# Altium project Orion-Bridge-R4.PrjPcb
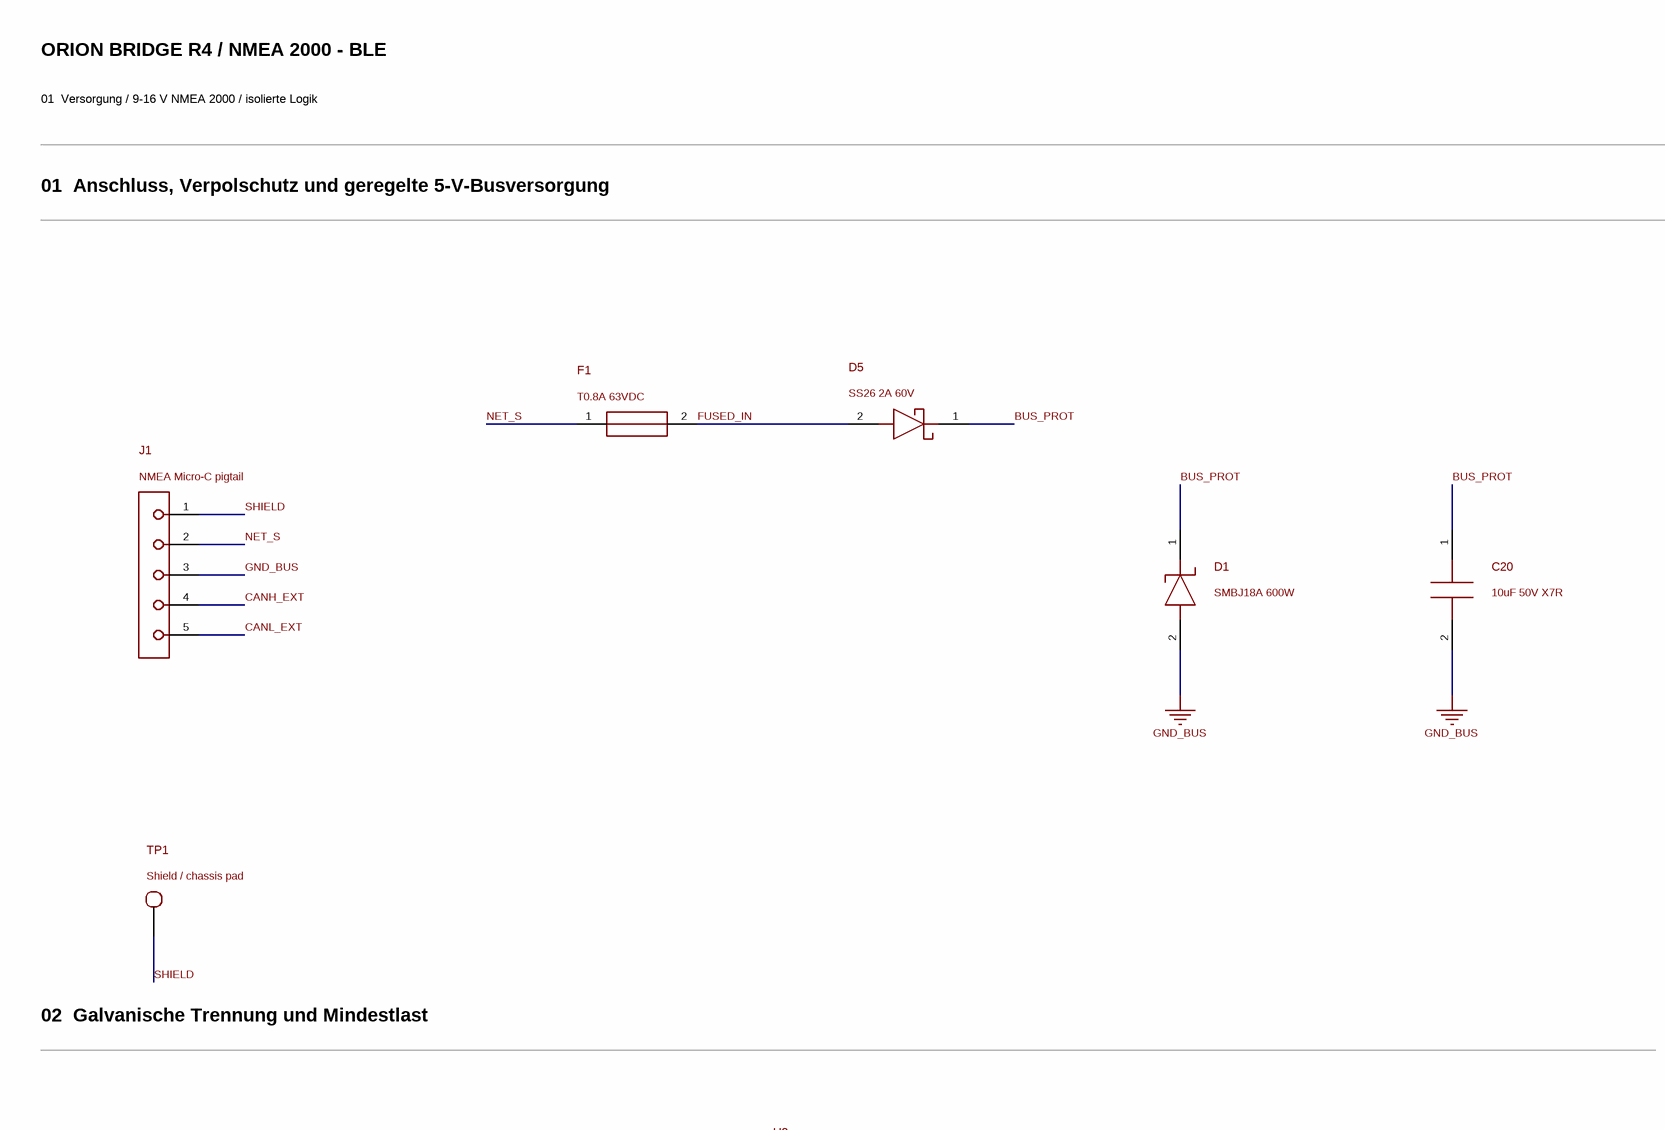
[diagram p0: Orion-Bridge-R4-Power.SchDoc, top left]
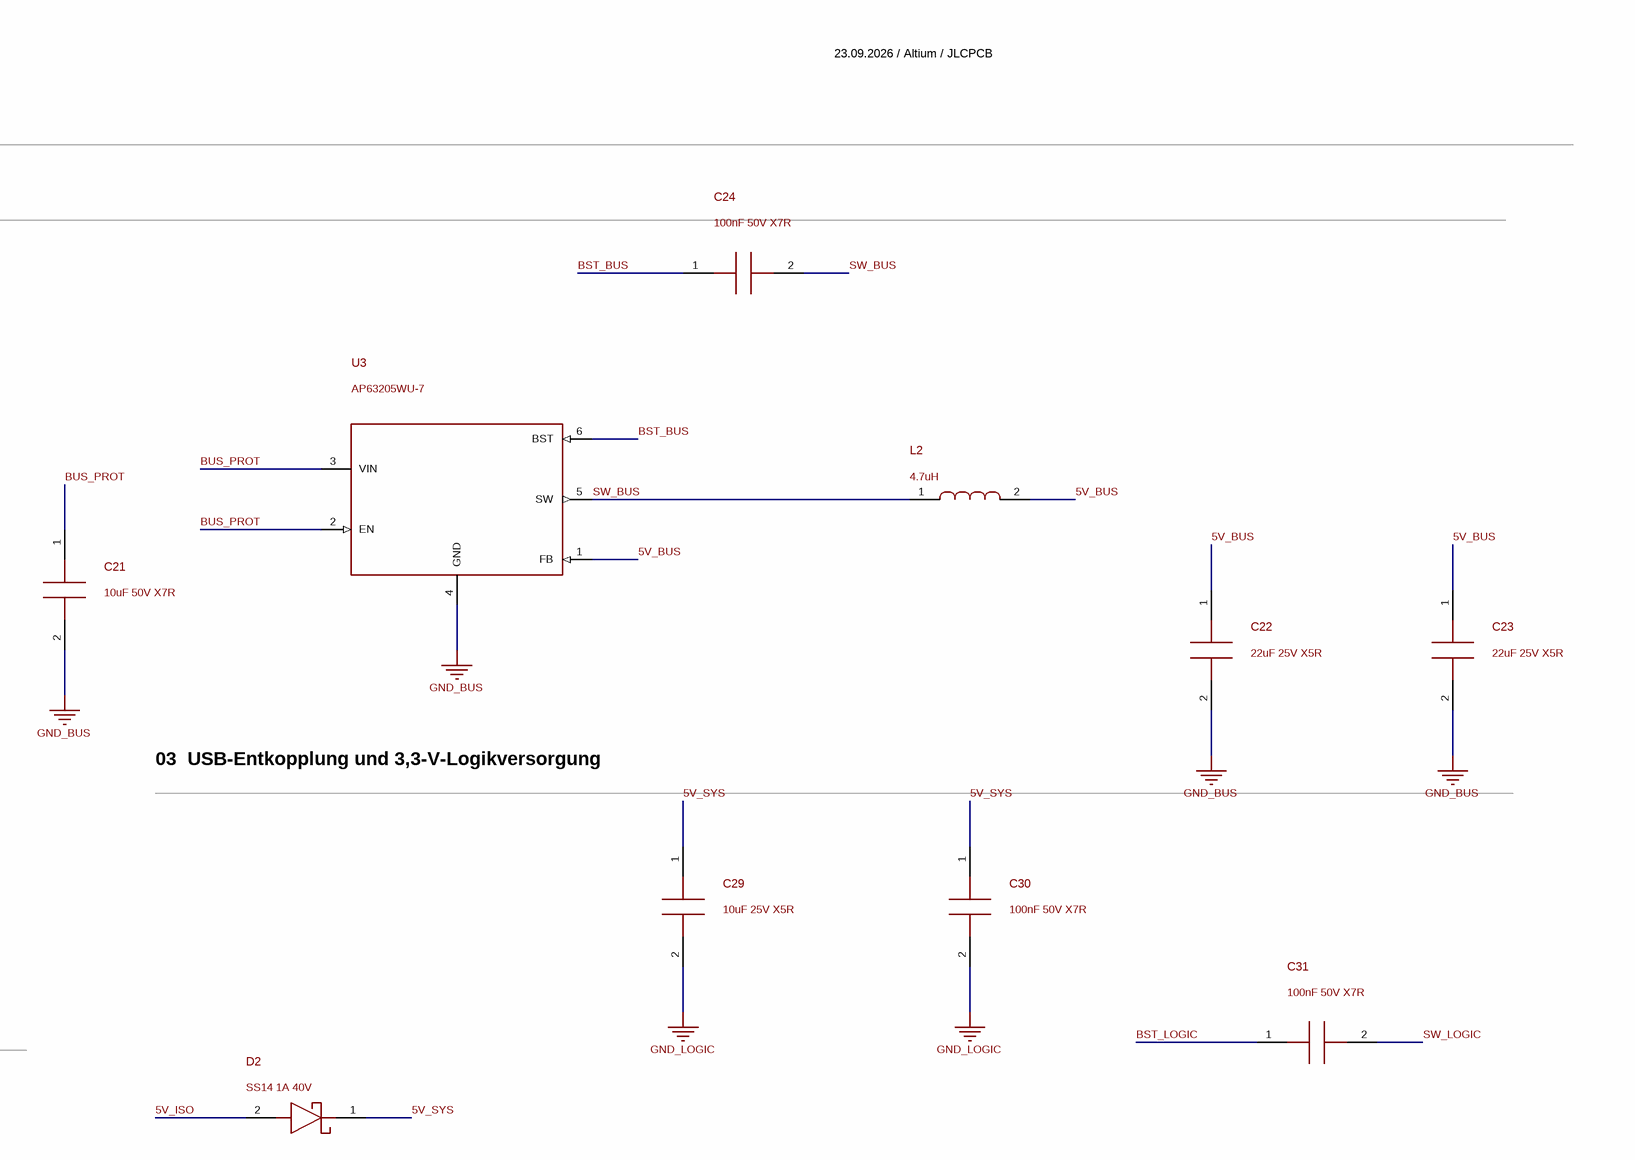
[diagram p1: Orion-Bridge-R4-Power.SchDoc, top right]
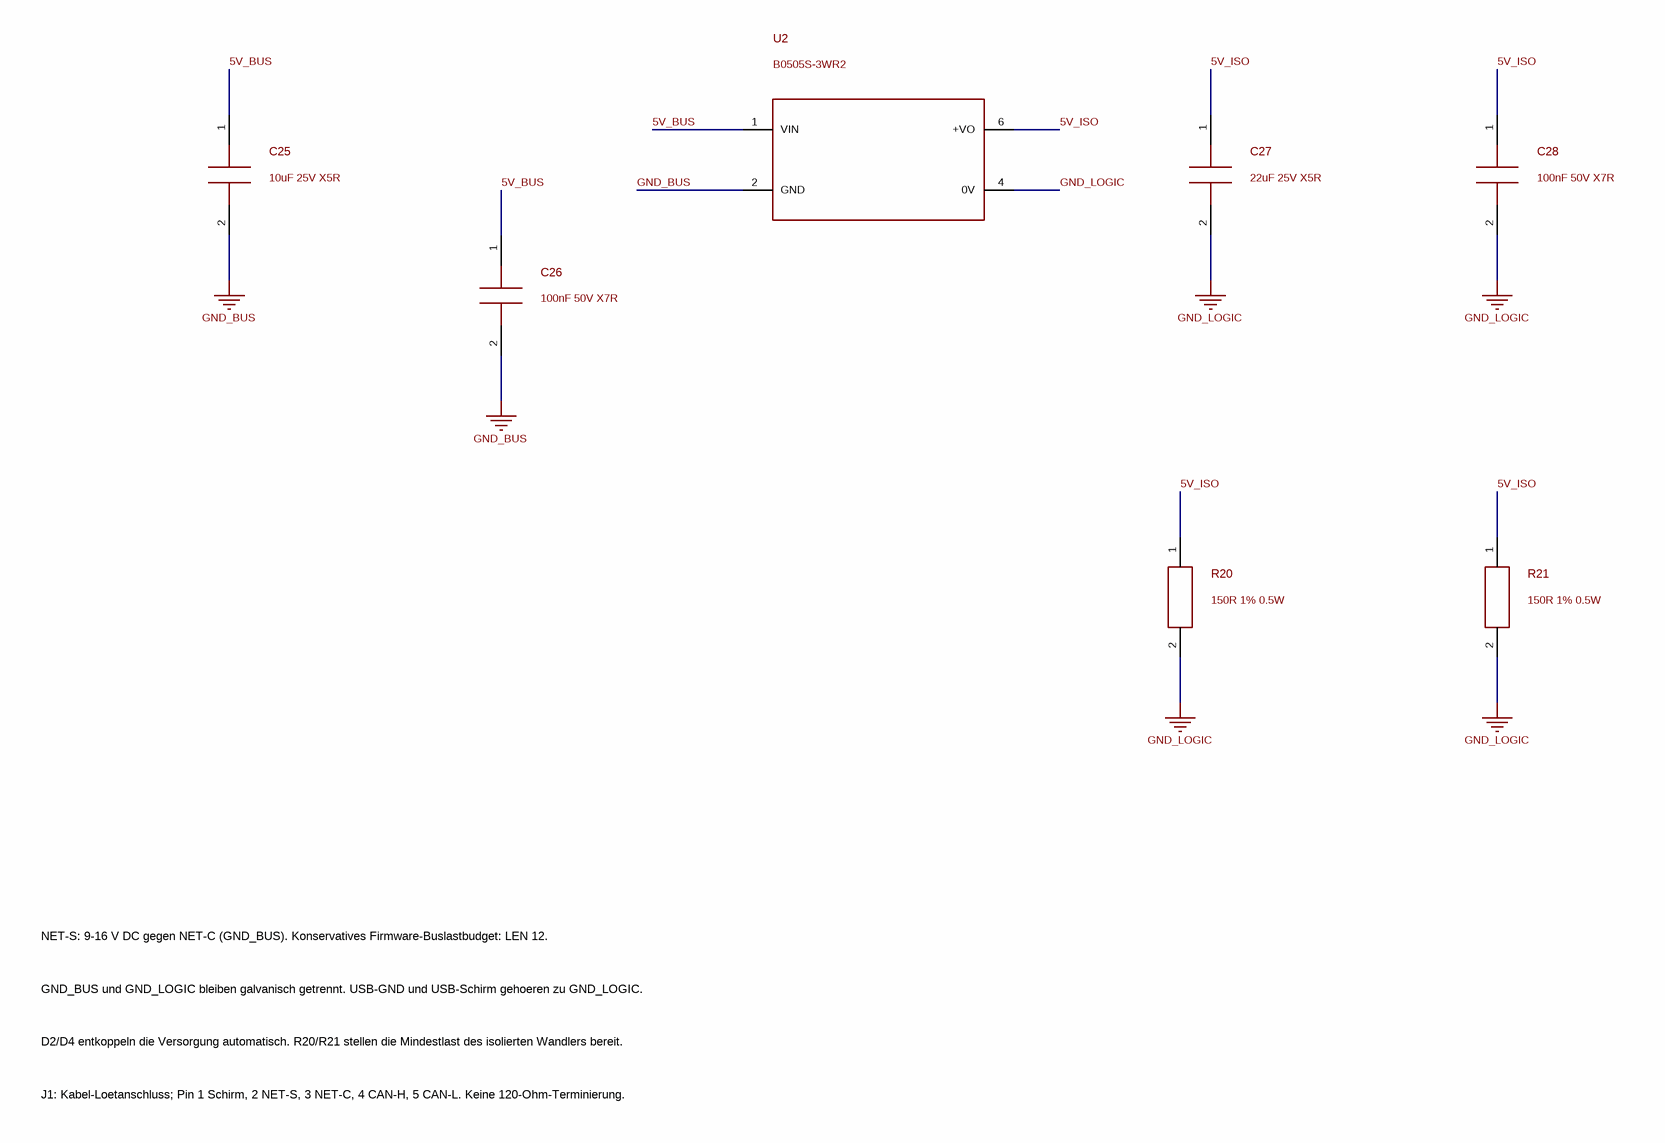
[diagram p2: Orion-Bridge-R4-Power.SchDoc, bottom left]
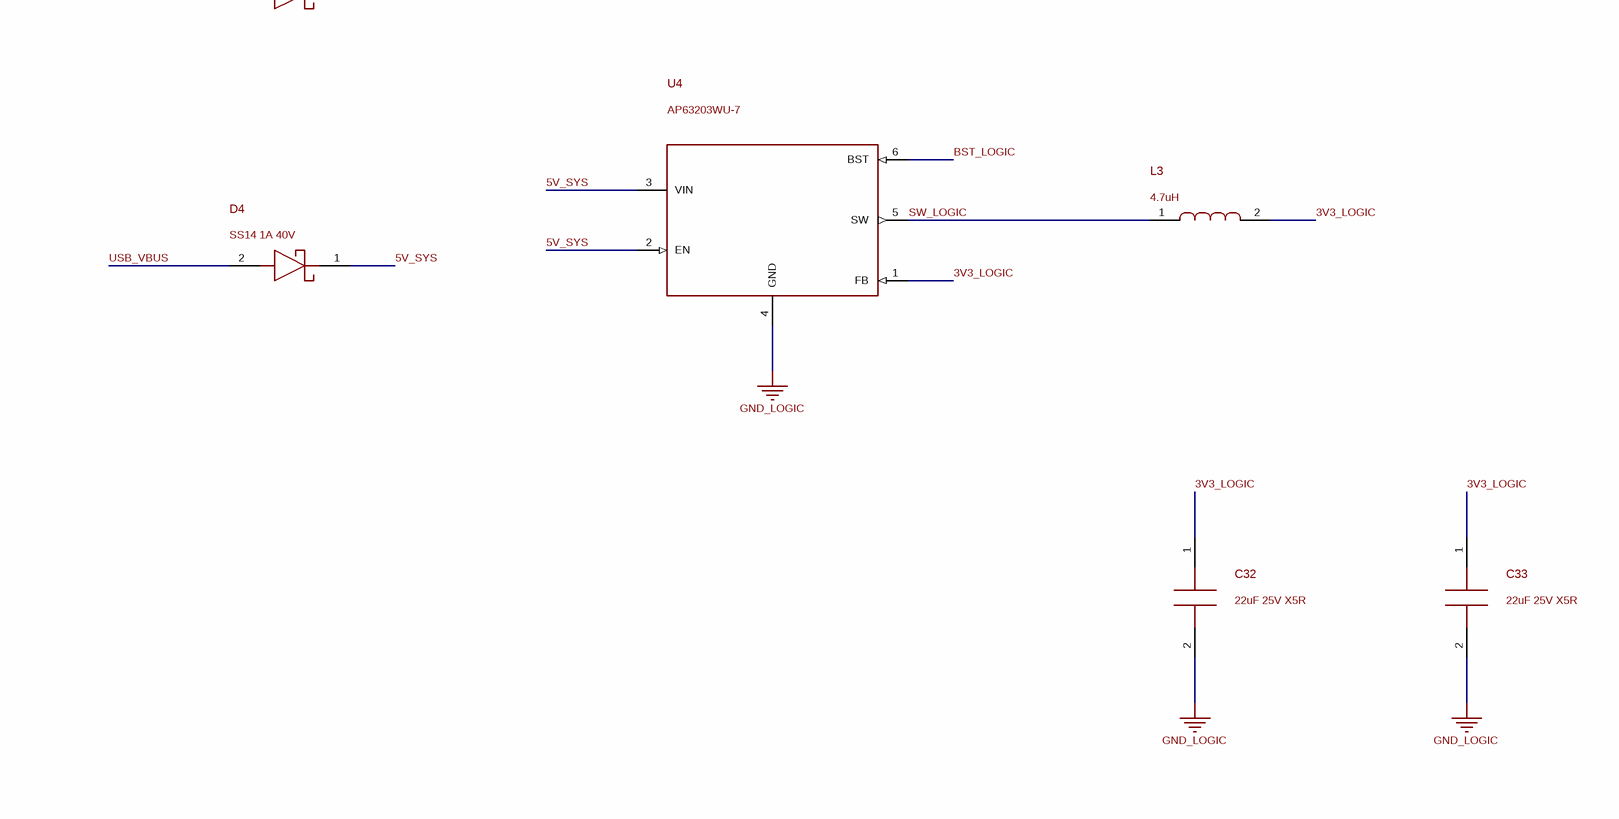
[diagram p3: Orion-Bridge-R4-Power.SchDoc, bottom right]
2 sheets, 52 parts. Net scope: global (net labels, ports and power ports of the same name join across sheets).
Board file: Orion-Bridge-R4.PcbDoc
Sheets:
  Orion-Bridge-R4-Power.SchDoc
  Orion-Bridge-R4-Logic.SchDoc

## Sheet Orion-Bridge-R4-Power.SchDoc
size A2

### Parts
C20  10uF 50V X7R  [C1210]
C21  10uF 50V X7R  [C1210]
C22  22uF 25V X5R  [C1206]
C23  22uF 25V X5R  [C1206]
C24  100nF 50V X7R  [C0603]
C25  10uF 25V X5R  [C0805]
C26  100nF 50V X7R  [C0603]
C27  22uF 25V X5R  [C1206]
C28  100nF 50V X7R  [C0603]
C29  10uF 25V X5R  [C0805]
C30  100nF 50V X7R  [C0603]
C31  100nF 50V X7R  [C0603]
C32  22uF 25V X5R  [C1206]
C33  22uF 25V X5R  [C1206]
D1  SMBJ18A 600W  [SMB]
D2  SS14 1A 40V  [SMA]
D4  SS14 1A 40V  [SMA]
D5  SS26 2A 60V  [SMA]
F1  T0.8A 63VDC  [BOURNS_SF1206S]
J1  NMEA Micro-C pigtail  [PIGTAIL_5_P3_D1P3]
L2  4.7uH  [SUNLORD_SWPA4030]
L3  4.7uH  [SUNLORD_SWPA4030]
R20  150R 1% 0.5W  [R1206]
R21  150R 1% 0.5W  [R1206]
TP1  Shield / chassis pad  [TESTPOINT_2MM]
U2  B0505S-3WR2  [EVISUN_B0505S_3WR2]
U3  AP63205WU-7  [TSOT26_DIODES]
U4  AP63203WU-7  [TSOT26_DIODES]

### Nets
GND_BUS: C20.2 C21.2 C22.2 C23.2 C25.2 C26.2 D1.2(A) J1.3(NET-C) U2.2(GND) U3.4(GND)
GND_LOGIC: C27.2 C28.2 C29.2 C30.2 C32.2 C33.2 R20.2 R21.2 U2.4(0V) U4.4(GND)
3V3_LOGIC: C32.1 C33.1 L3.2 U4.1(FB)
5V_BUS: C22.1 C23.1 C25.1 C26.1 L2.2 U2.1(VIN) U3.1(FB)
5V_ISO: C27.1 C28.1 D2.2(A) R20.1 R21.1 U2.6(+VO)
5V_SYS: C29.1 C30.1 D2.1(K) D4.1(K) U4.2(EN) U4.3(VIN)
BST_BUS: C24.1 U3.6(BST)
BST_LOGIC: C31.1 U4.6(BST)
BUS_PROT: C20.1 C21.1 D1.1(K) D5.1(K) U3.2(EN) U3.3(VIN)
CANH_EXT: J1.4(CAN-H)
CANL_EXT: J1.5(CAN-L)
FUSED_IN: D5.2(A) F1.2
NET_S: F1.1 J1.2(NET-S)
SHIELD: J1.1(SHIELD) TP1.1(SHIELD)
SW_BUS: C24.2 L2.1 U3.5(SW)
SW_LOGIC: C31.2 L3.1 U4.5(SW)
USB_VBUS: D4.2(A)

### Notes on the sheet
- ORION BRIDGE R4 / NMEA 2000 - BLE
- 23.09.2026 / Altium / JLCPCB
- 01  Versorgung / 9-16 V NMEA 2000 / isolierte Logik
- 01  Anschluss, Verpolschutz und geregelte 5-V-Busversorgung
- 03  USB-Entkopplung und 3,3-V-Logikversorgung
- 02  Galvanische Trennung und Mindestlast
- NET-S: 9-16 V DC gegen NET-C (GND_BUS). Konservatives Firmware-Buslastbudget: LEN 12.
- GND_BUS und GND_LOGIC bleiben galvanisch getrennt. USB-GND und USB-Schirm gehoeren zu GND_LOGIC.
- D2/D4 entkoppeln die Versorgung automatisch. R20/R21 stellen die Mindestlast des isolierten Wandlers bereit.
- J1: Kabel-Loetanschluss; Pin 1 Schirm, 2 NET-S, 3 NET-C, 4 CAN-H, 5 CAN-L. Keine 120-Ohm-Terminierung.

### Library data of the parts
C20 = R4_C20_10uF: Manufacturer: Samsung Electro-Mechanics; MPN: CL32B106KBJNNNE; ReviewStatus: R4 reviewed package; see source and assembly audit; Manufacturer Part Number: CL32B106KBJNNNE; Description: 10uF 50V X7R; Datasheet: https://datasheet.lcsc.com/lcsc/1912112237_Samsung-Electro-Mechanics-CL32B106KBJNNNE_C138687.pdf; Supplier 1: LCSC; Supplier Part Number 1: C138687; Footprint Status: R4 reviewed package; see source and assembly audit
C21 = R4_C21_10uF: Manufacturer: Samsung Electro-Mechanics; MPN: CL32B106KBJNNNE; ReviewStatus: R4 reviewed package; see source and assembly audit; Manufacturer Part Number: CL32B106KBJNNNE; Description: 10uF 50V X7R; Datasheet: https://datasheet.lcsc.com/lcsc/1912112237_Samsung-Electro-Mechanics-CL32B106KBJNNNE_C138687.pdf; Supplier 1: LCSC; Supplier Part Number 1: C138687; Footprint Status: R4 reviewed package; see source and assembly audit
C22 = R4_C22_22uF: Manufacturer: Samsung Electro-Mechanics; MPN: CL31A226KAHNNNE; ReviewStatus: R4 reviewed package; see source and assembly audit; Manufacturer Part Number: CL31A226KAHNNNE; Description: 22uF 25V X5R; Datasheet: https://www.lcsc.com/datasheet/lcsc_datasheet_2304140030_Samsung-Electro-Mechanics-CL31A226KAHNNNE_C12891.pdf; Supplier 1: LCSC; Supplier Part Number 1: C12891; Footprint Status: R4 reviewed package; see source and assembly audit
C23 = R4_C23_22uF: Manufacturer: Samsung Electro-Mechanics; MPN: CL31A226KAHNNNE; ReviewStatus: R4 reviewed package; see source and assembly audit; Manufacturer Part Number: CL31A226KAHNNNE; Description: 22uF 25V X5R; Datasheet: https://www.lcsc.com/datasheet/lcsc_datasheet_2304140030_Samsung-Electro-Mechanics-CL31A226KAHNNNE_C12891.pdf; Supplier 1: LCSC; Supplier Part Number 1: C12891; Footprint Status: R4 reviewed package; see source and assembly audit
C24 = R4_C24_100nF: Manufacturer: YAGEO; MPN: CC0603KRX7R9BB104; ReviewStatus: R4 reviewed package; see source and assembly audit; Manufacturer Part Number: CC0603KRX7R9BB104; Description: 100nF 50V X7R; Datasheet: https://www.lcsc.com/datasheet/lcsc_datasheet_2211101700_YAGEO-CC0603KRX7R9BB104_C14663.pdf; Supplier 1: LCSC; Supplier Part Number 1: C14663; Footprint Status: R4 reviewed package; see source and assembly audit
C25 = R4_C25_10uF: Manufacturer: Samsung Electro-Mechanics; MPN: CL21A106KAYNNNE; ReviewStatus: R4 reviewed package; see source and assembly audit; Manufacturer Part Number: CL21A106KAYNNNE; Description: 10uF 25V X5R; Datasheet: https://www.lcsc.com/datasheet/lcsc_datasheet_2304140030_Samsung-Electro-Mechanics-CL21A106KAYNNNE_C15850.pdf; Supplier 1: LCSC; Supplier Part Number 1: C15850; Footprint Status: R4 reviewed package; see source and assembly audit
C26 = R4_C26_100nF: Manufacturer: YAGEO; MPN: CC0603KRX7R9BB104; ReviewStatus: R4 reviewed package; see source and assembly audit; Manufacturer Part Number: CC0603KRX7R9BB104; Description: 100nF 50V X7R; Datasheet: https://www.lcsc.com/datasheet/lcsc_datasheet_2211101700_YAGEO-CC0603KRX7R9BB104_C14663.pdf; Supplier 1: LCSC; Supplier Part Number 1: C14663; Footprint Status: R4 reviewed package; see source and assembly audit
C27 = R4_C27_22uF: Manufacturer: Samsung Electro-Mechanics; MPN: CL31A226KAHNNNE; ReviewStatus: R4 reviewed package; see source and assembly audit; Manufacturer Part Number: CL31A226KAHNNNE; Description: 22uF 25V X5R; Datasheet: https://www.lcsc.com/datasheet/lcsc_datasheet_2304140030_Samsung-Electro-Mechanics-CL31A226KAHNNNE_C12891.pdf; Supplier 1: LCSC; Supplier Part Number 1: C12891; Footprint Status: R4 reviewed package; see source and assembly audit
C28 = R4_C28_100nF: Manufacturer: YAGEO; MPN: CC0603KRX7R9BB104; ReviewStatus: R4 reviewed package; see source and assembly audit; Manufacturer Part Number: CC0603KRX7R9BB104; Description: 100nF 50V X7R; Datasheet: https://www.lcsc.com/datasheet/lcsc_datasheet_2211101700_YAGEO-CC0603KRX7R9BB104_C14663.pdf; Supplier 1: LCSC; Supplier Part Number 1: C14663; Footprint Status: R4 reviewed package; see source and assembly audit
C29 = R4_C29_10uF: Manufacturer: Samsung Electro-Mechanics; MPN: CL21A106KAYNNNE; ReviewStatus: R4 reviewed package; see source and assembly audit; Manufacturer Part Number: CL21A106KAYNNNE; Description: 10uF 25V X5R; Datasheet: https://www.lcsc.com/datasheet/lcsc_datasheet_2304140030_Samsung-Electro-Mechanics-CL21A106KAYNNNE_C15850.pdf; Supplier 1: LCSC; Supplier Part Number 1: C15850; Footprint Status: R4 reviewed package; see source and assembly audit
C30 = R4_C30_100nF: Manufacturer: YAGEO; MPN: CC0603KRX7R9BB104; ReviewStatus: R4 reviewed package; see source and assembly audit; Manufacturer Part Number: CC0603KRX7R9BB104; Description: 100nF 50V X7R; Datasheet: https://www.lcsc.com/datasheet/lcsc_datasheet_2211101700_YAGEO-CC0603KRX7R9BB104_C14663.pdf; Supplier 1: LCSC; Supplier Part Number 1: C14663; Footprint Status: R4 reviewed package; see source and assembly audit
C31 = R4_C31_100nF: Manufacturer: YAGEO; MPN: CC0603KRX7R9BB104; ReviewStatus: R4 reviewed package; see source and assembly audit; Manufacturer Part Number: CC0603KRX7R9BB104; Description: 100nF 50V X7R; Datasheet: https://www.lcsc.com/datasheet/lcsc_datasheet_2211101700_YAGEO-CC0603KRX7R9BB104_C14663.pdf; Supplier 1: LCSC; Supplier Part Number 1: C14663; Footprint Status: R4 reviewed package; see source and assembly audit
C32 = R4_C32_22uF: Manufacturer: Samsung Electro-Mechanics; MPN: CL31A226KAHNNNE; ReviewStatus: R4 reviewed package; see source and assembly audit; Manufacturer Part Number: CL31A226KAHNNNE; Description: 22uF 25V X5R; Datasheet: https://www.lcsc.com/datasheet/lcsc_datasheet_2304140030_Samsung-Electro-Mechanics-CL31A226KAHNNNE_C12891.pdf; Supplier 1: LCSC; Supplier Part Number 1: C12891; Footprint Status: R4 reviewed package; see source and assembly audit
C33 = R4_C33_22uF: Manufacturer: Samsung Electro-Mechanics; MPN: CL31A226KAHNNNE; ReviewStatus: R4 reviewed package; see source and assembly audit; Manufacturer Part Number: CL31A226KAHNNNE; Description: 22uF 25V X5R; Datasheet: https://www.lcsc.com/datasheet/lcsc_datasheet_2304140030_Samsung-Electro-Mechanics-CL31A226KAHNNNE_C12891.pdf; Supplier 1: LCSC; Supplier Part Number 1: C12891; Footprint Status: R4 reviewed package; see source and assembly audit
D1 = R4_D1_SMBJ18A: Manufacturer: BORN; ReviewStatus: R4 reviewed package; see source and assembly audit; MPN: SMBJ18A; Manufacturer Part Number: SMBJ18A; Description: SMBJ18A 600W; Datasheet: https://www.lcsc.com/datasheet/lcsc_datasheet_2304140030_BORN-SMBJ18A_C152104.pdf; Supplier 1: LCSC; Supplier Part Number 1: C152104; Footprint Status: R4 reviewed package; see source and assembly audit
D2 = R4_D2_SS14: Manufacturer: MDD(Microdiode Semiconductor); ReviewStatus: R4 reviewed package; see source and assembly audit; MPN: SS14; Manufacturer Part Number: SS14; Description: SS14 1A 40V; Datasheet: https://www.lcsc.com/datasheet/lcsc_datasheet_2407101109_MDD-Microdiode-Semiconductor-SS14_C2480.pdf; Supplier 1: LCSC; Supplier Part Number 1: C2480; Footprint Status: R4 reviewed package; see source and assembly audit
D4 = R4_D4_SS14: Manufacturer: MDD(Microdiode Semiconductor); ReviewStatus: R4 reviewed package; see source and assembly audit; MPN: SS14; Manufacturer Part Number: SS14; Description: SS14 1A 40V; Datasheet: https://www.lcsc.com/datasheet/lcsc_datasheet_2407101109_MDD-Microdiode-Semiconductor-SS14_C2480.pdf; Supplier 1: LCSC; Supplier Part Number 1: C2480; Footprint Status: R4 reviewed package; see source and assembly audit
D5 = R4_D5_SS26: Manufacturer: MDD(Microdiode Semiconductor); ReviewStatus: R4 reviewed package; see source and assembly audit; MPN: SS26; Manufacturer Part Number: SS26; Description: SS26 2A 60V; Datasheet: https://www.lcsc.com/datasheet/lcsc_datasheet_2407101107_MDD-Microdiode-Semiconductor-SS26_C14238.pdf; Supplier 1: LCSC; Supplier Part Number 1: C14238; Footprint Status: R4 reviewed package; see source and assembly audit
F1 = R4_F1_T0.8A: 0.8 A slow-blow SMD ceramic fuse, 63 VDC, 50 A interrupt rating; Manufacturer: BOURNS; MPN: SF-1206S080-2; ReviewStatus: R4 reviewed package; see source and assembly audit; Manufacturer Part Number: SF-1206S080-2; Datasheet: https://wmsc.lcsc.com/wmsc/upload/file/pdf/v2/lcsc/2304140030_BOURNS-SF-1206S080-2_C3032873.pdf; Supplier 1: LCSC; Supplier Part Number 1: C3032873; Footprint Status: R4 reviewed package; see source and assembly audit
J1 = R4_J1_NMEA: Five direct wire-solder pads for a separately selected Micro-C cable; this is a PCB interface, not an invented connector MPN or face view; ReviewStatus: R4 reviewed package; see source and assembly audit; Footprint Status: R4 reviewed package; see source and assembly audit
L2 = R4_L2_4.7uH: Manufacturer: Sunlord; MPN: SWPA4030S4R7MT; ReviewStatus: R4 reviewed package; see source and assembly audit; Manufacturer Part Number: SWPA4030S4R7MT; Description: 4.7uH; Datasheet: https://www.lcsc.com/datasheet/lcsc_datasheet_2310251551_Sunlord-SWPA4030S4R7MT_C57269.pdf; Supplier 1: LCSC; Supplier Part Number 1: C57269; Footprint Status: R4 reviewed package; see source and assembly audit
L3 = R4_L3_4.7uH: Manufacturer: Sunlord; MPN: SWPA4030S4R7MT; ReviewStatus: R4 reviewed package; see source and assembly audit; Manufacturer Part Number: SWPA4030S4R7MT; Description: 4.7uH; Datasheet: https://www.lcsc.com/datasheet/lcsc_datasheet_2310251551_Sunlord-SWPA4030S4R7MT_C57269.pdf; Supplier 1: LCSC; Supplier Part Number 1: C57269; Footprint Status: R4 reviewed package; see source and assembly audit
R20 = R4_R20_150R: Manufacturer: SEI(Stackpole Elec); MPN: RNCP1206FTD150R; ReviewStatus: R4 reviewed package; see source and assembly audit; Manufacturer Part Number: RNCP1206FTD150R; Description: 150R 1% 0.5W; Datasheet: https://wmsc.lcsc.com/wmsc/upload/file/pdf/v2/lcsc/2404111532_SEI-Stackpole-Elec-RNCP1206FTD150R_C4258541.pdf; Supplier 1: LCSC; Supplier Part Number 1: C4258541; Footprint Status: R4 reviewed package; see source and assembly audit
R21 = R4_R21_150R: Manufacturer: SEI(Stackpole Elec); MPN: RNCP1206FTD150R; ReviewStatus: R4 reviewed package; see source and assembly audit; Manufacturer Part Number: RNCP1206FTD150R; Description: 150R 1% 0.5W; Datasheet: https://wmsc.lcsc.com/wmsc/upload/file/pdf/v2/lcsc/2404111532_SEI-Stackpole-Elec-RNCP1206FTD150R_C4258541.pdf; Supplier 1: LCSC; Supplier Part Number 1: C4258541; Footprint Status: R4 reviewed package; see source and assembly audit
TP1 = R4_TP1_Shield: Shield / chassis pad - generic specification; manufacturer/MPN not selected; ReviewStatus: R4 reviewed package; see source and assembly audit; Footprint Status: R4 reviewed package; see source and assembly audit
U2 = R4_U2_B0505S_3WR2: Manufacturer: EVISUN; ReviewStatus: R4 reviewed package; see source and assembly audit; MPN: B0505S-3WR2; Manufacturer Part Number: B0505S-3WR2; Description: B0505S-3WR2; Datasheet: https://wmsc.lcsc.com/wmsc/upload/file/pdf/v2/lcsc/2308311627_EVISUN-B0505S-3WR2_C7500927.pdf; Supplier 1: LCSC; Supplier Part Number 1: C7500927; Footprint Status: R4 reviewed package; see source and assembly audit
U3 = R4_U3_AP63205WU_7: Manufacturer: Diodes Incorporated; ReviewStatus: R4 reviewed package; see source and assembly audit; MPN: AP63205WU-7; Manufacturer Part Number: AP63205WU-7; Description: AP63205WU-7; Datasheet: https://www.lcsc.com/datasheet/lcsc_datasheet_2210280930_Diodes-Incorporated-AP63205WU-7_C2071056.pdf; Supplier 1: LCSC; Supplier Part Number 1: C2071056; Footprint Status: R4 reviewed package; see source and assembly audit
U4 = R4_U4_AP63203WU_7: Manufacturer: Diodes Incorporated; ReviewStatus: R4 reviewed package; see source and assembly audit; MPN: AP63203WU-7; Manufacturer Part Number: AP63203WU-7; Description: AP63203WU-7; Datasheet: https://www.lcsc.com/datasheet/lcsc_datasheet_2201131130_Diodes-Incorporated-AP63203WU-7_C780769.pdf; Supplier 1: LCSC; Supplier Part Number 1: C780769; Footprint Status: R4 reviewed package; see source and assembly audit

## Sheet Orion-Bridge-R4-Logic.SchDoc
size A2
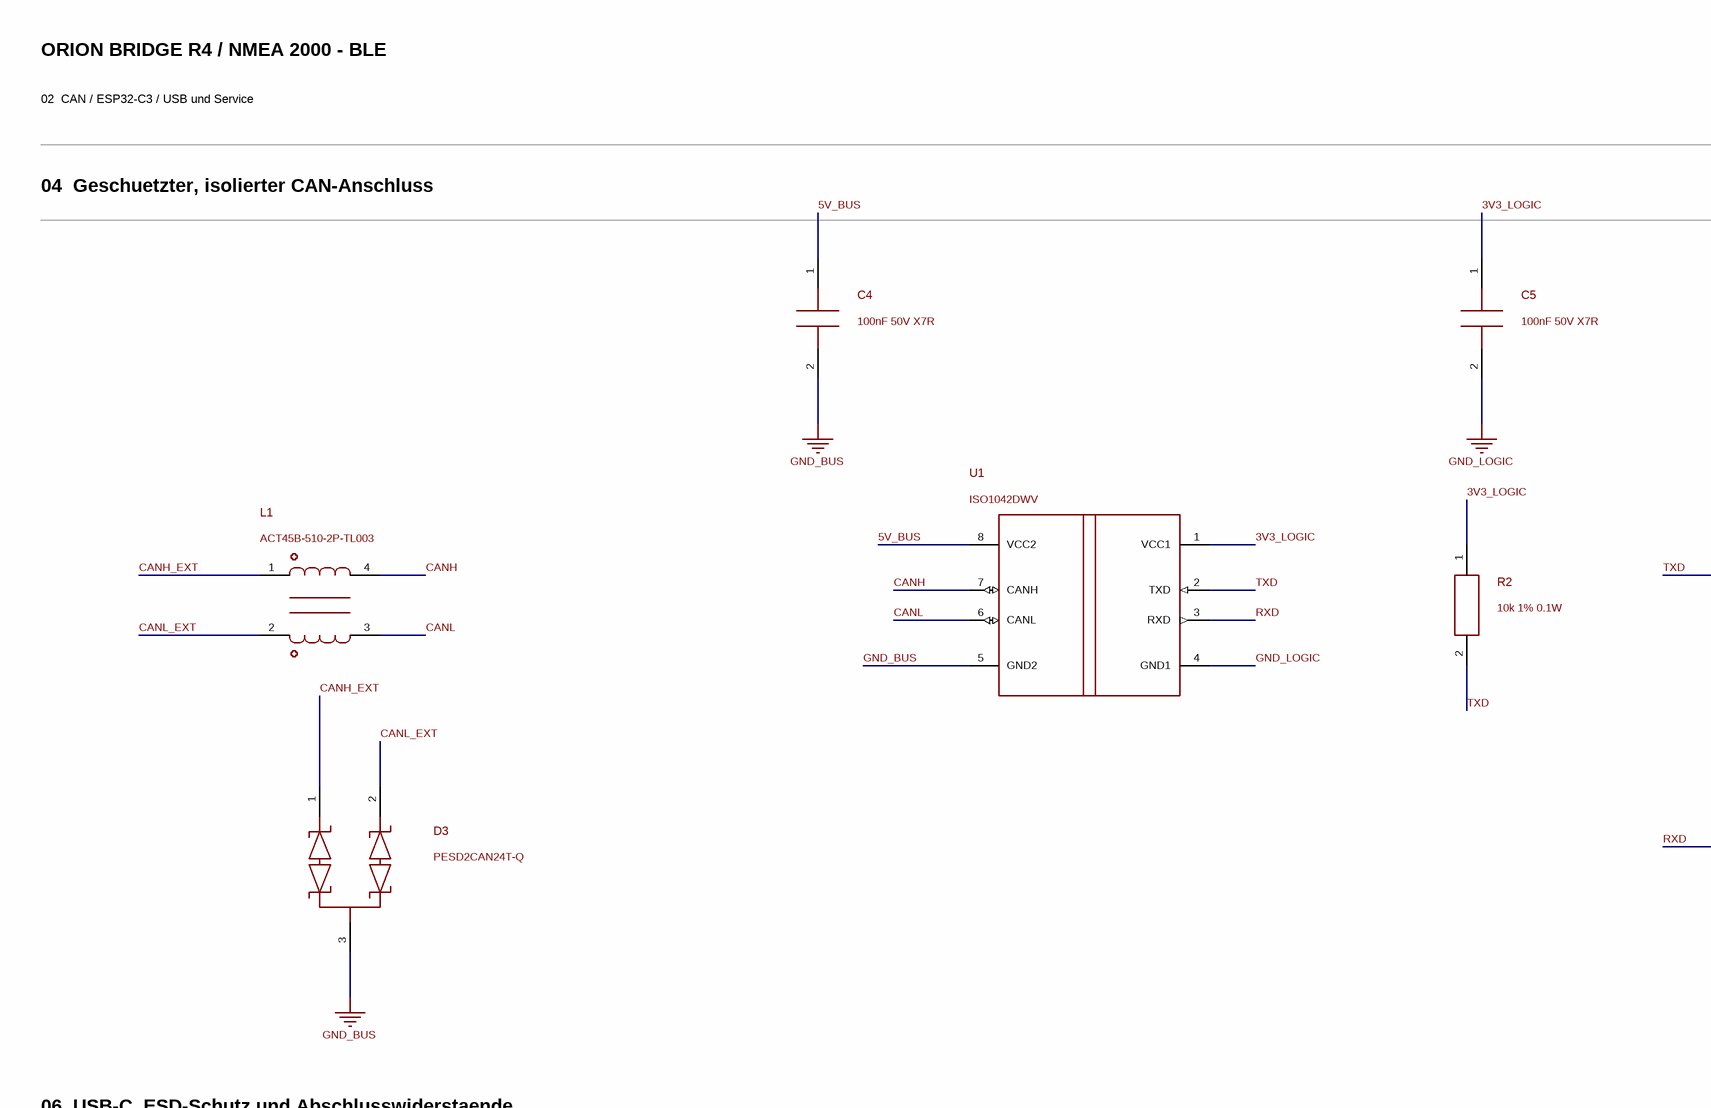
[diagram p4: Orion-Bridge-R4-Logic.SchDoc, top left]
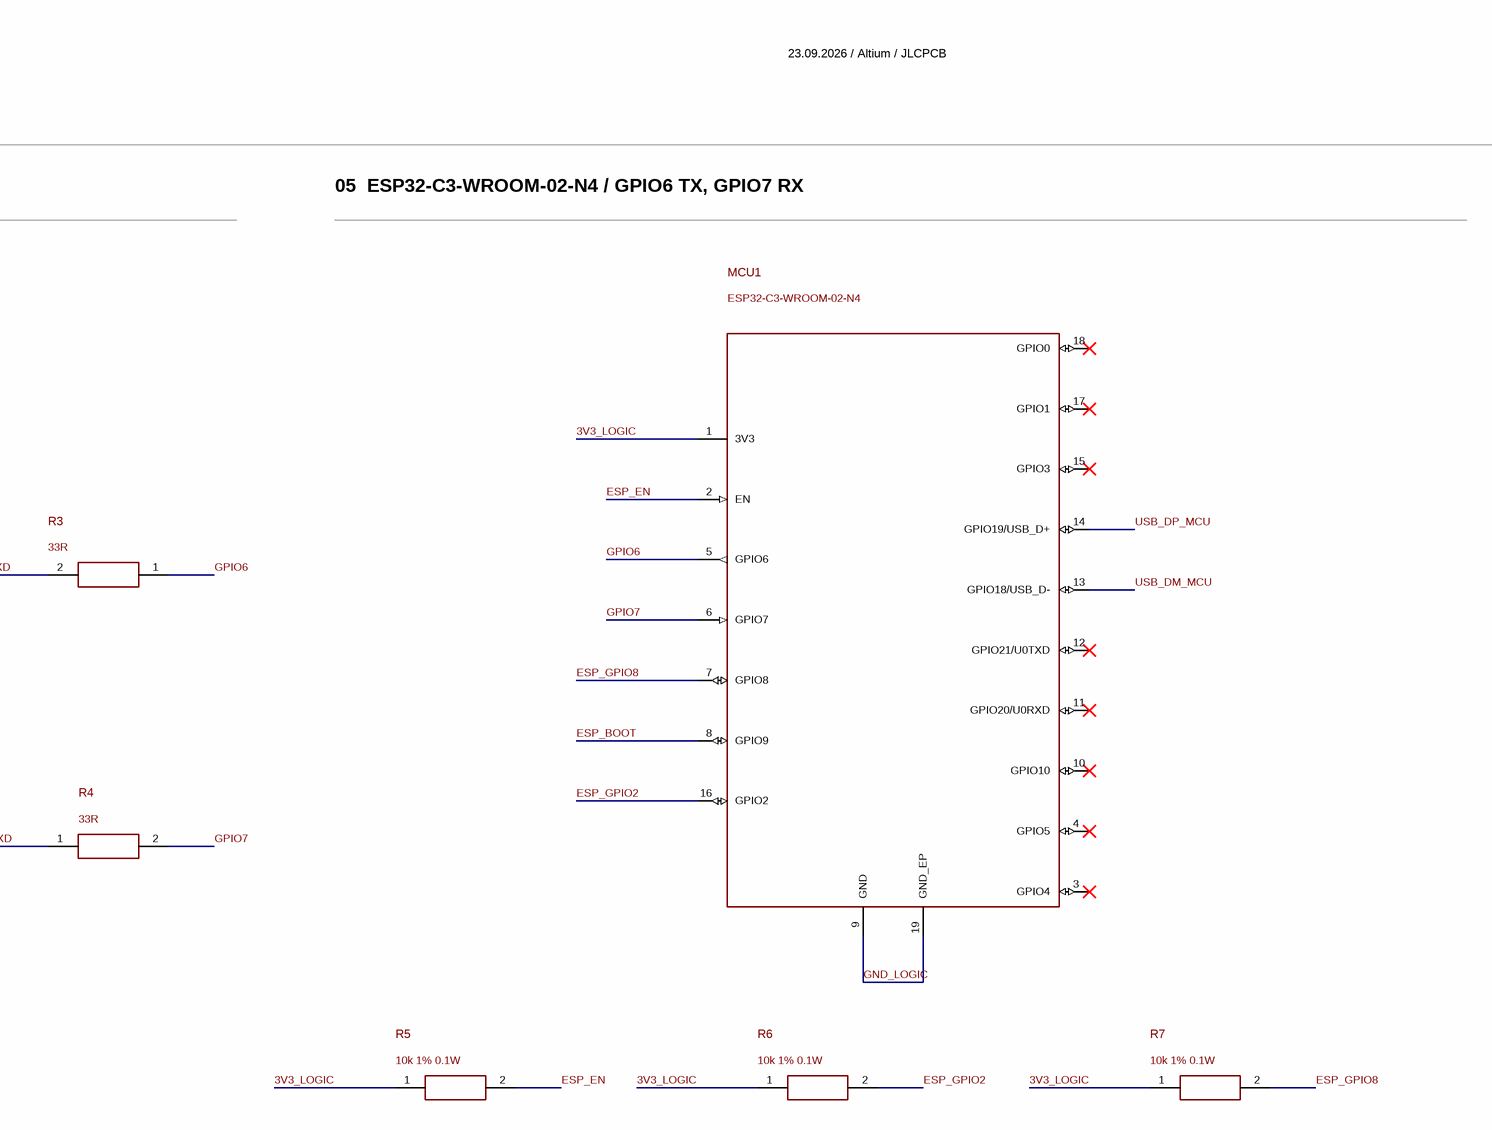
[diagram p5: Orion-Bridge-R4-Logic.SchDoc, top right]
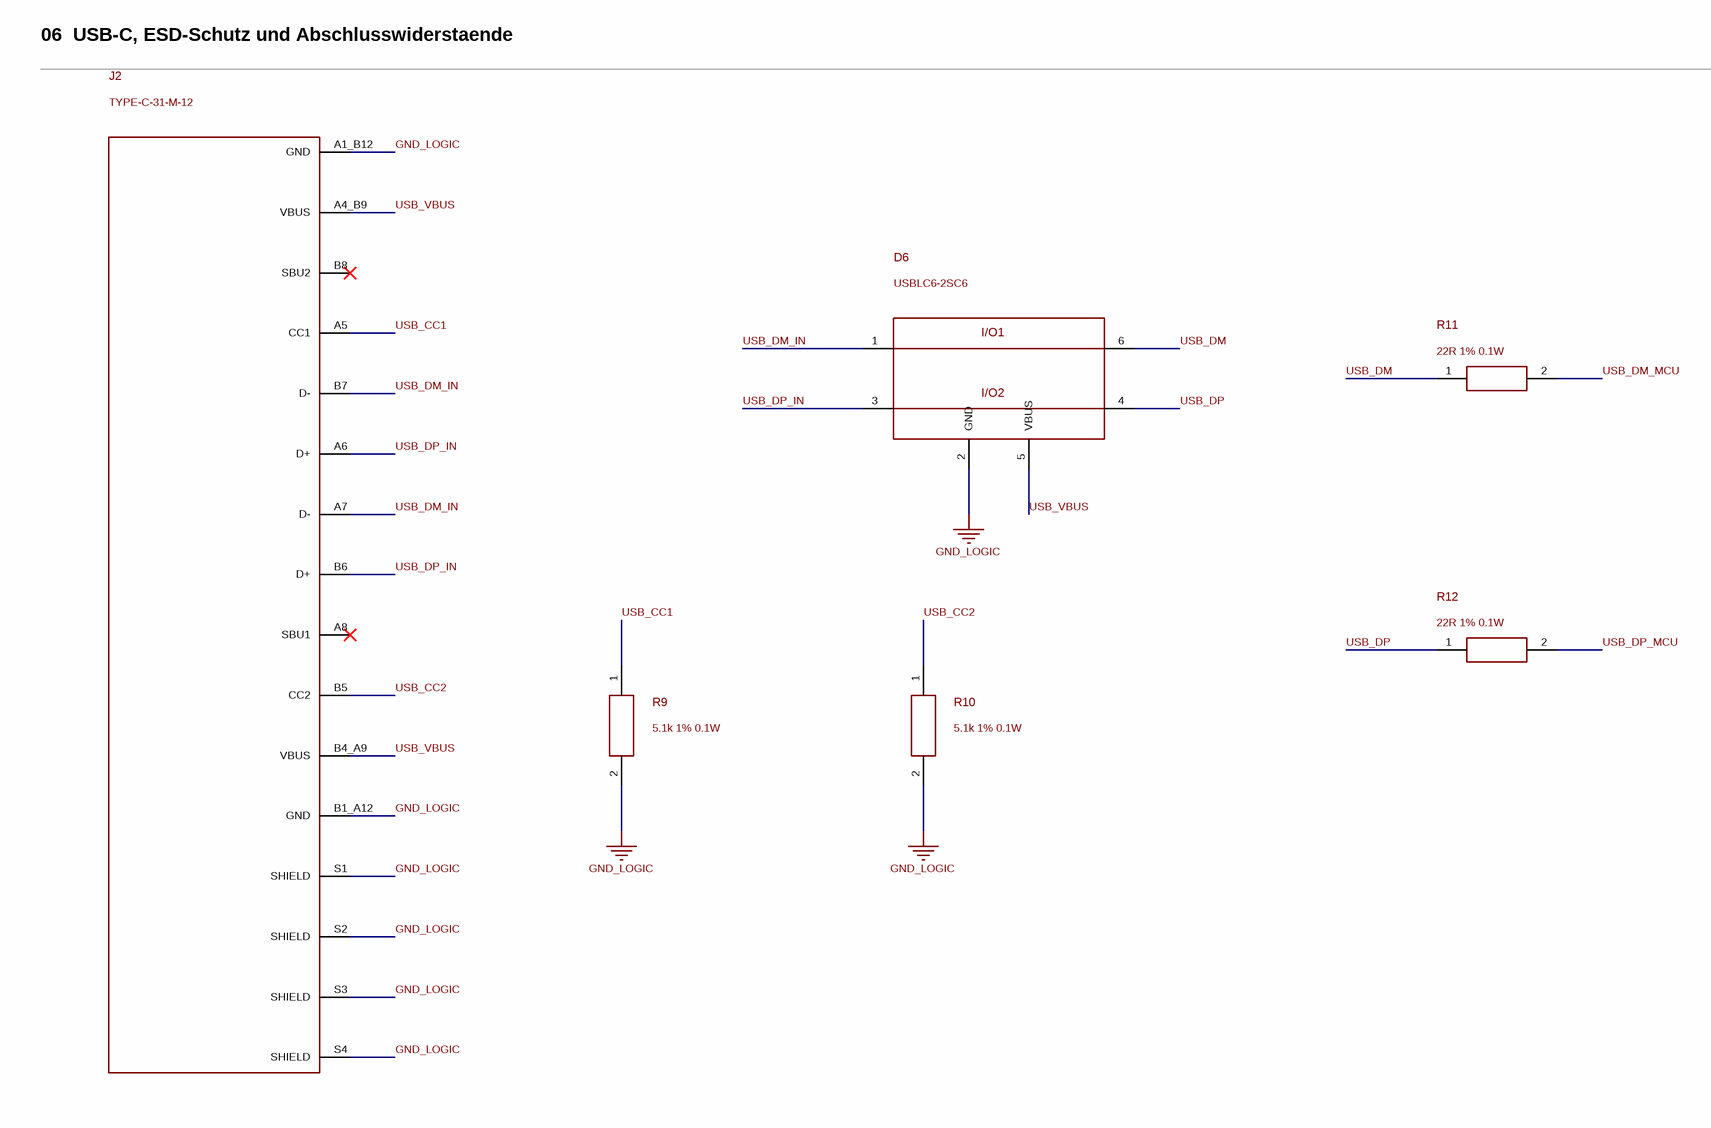
[diagram p6: Orion-Bridge-R4-Logic.SchDoc, bottom left]
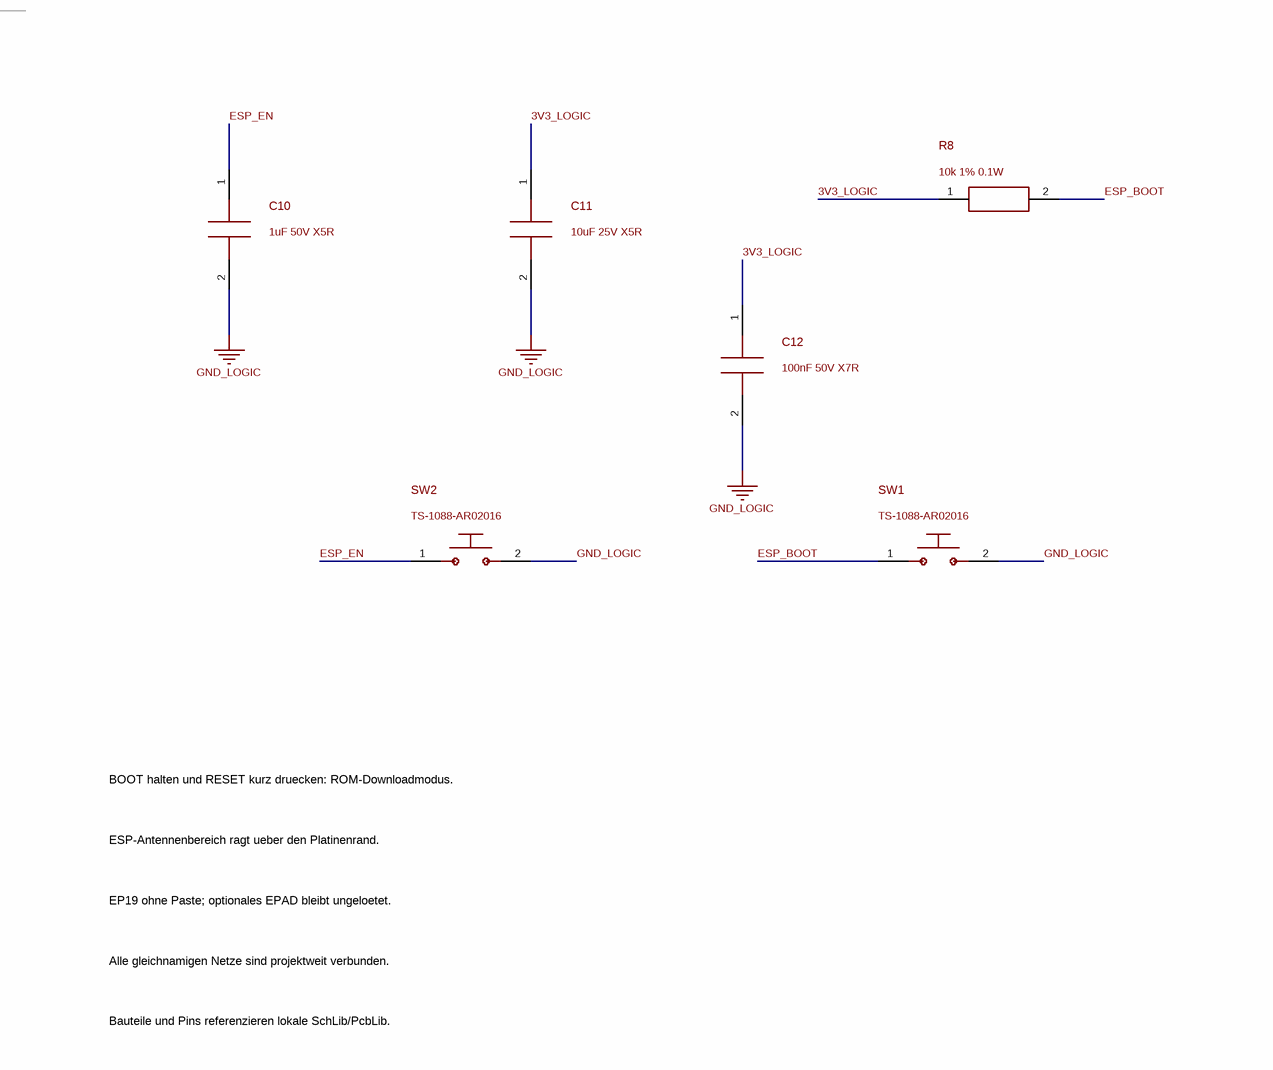
[diagram p7: Orion-Bridge-R4-Logic.SchDoc, bottom right]

### Parts
C4  100nF 50V X7R  [C0603]
C5  100nF 50V X7R  [C0603]
C10  1uF 50V X5R  [C0603]
C11  10uF 25V X5R  [C0805]
C12  100nF 50V X7R  [C0603]
D3  PESD2CAN24T-Q  [SOT23_NEXPERIA_REFLOW]
D6  USBLC6-2SC6  [SOT23_6_ST_USBLC6]
J2  TYPE-C-31-M-12  [USB_C_HRO_TYPE_C_31_M_12_2020]
L1  ACT45B-510-2P-TL003  [ACT45B]
MCU1  ESP32-C3-WROOM-02-N4  [ESP32_C3_WROOM_02]
R2  10k 1% 0.1W  [R0603]
R3  33R  [R0603]
R4  33R  [R0603]
R5  10k 1% 0.1W  [R0603]
R6  10k 1% 0.1W  [R0603]
R7  10k 1% 0.1W  [R0603]
R8  10k 1% 0.1W  [R0603]
R9  5.1k 1% 0.1W  [R0603]
R10  5.1k 1% 0.1W  [R0603]
R11  22R 1% 0.1W  [R0603]
R12  22R 1% 0.1W  [R0603]
SW1  TS-1088-AR02016  [SW_XUNPU_TS1088_AR]
SW2  TS-1088-AR02016  [SW_XUNPU_TS1088_AR]
U1  ISO1042DWV  [SOIC8_DWV]

### Nets
GND_BUS: C4.2 D3.3(CC) U1.5(GND2)
GND_LOGIC: C5.2 C10.2 C11.2 C12.2 D6.2(GND) J2.A1_B12(GND) J2.B1_A12(GND) J2.S1(SHIELD) J2.S2(SHIELD) J2.S3(SHIELD) J2.S4(SHIELD) MCU1.9(GND) MCU1.19(GND_EP) R9.2 R10.2 SW1.2(B) SW2.2(B) U1.4(GND1)
3V3_LOGIC: C5.1 C11.1 C12.1 MCU1.1(3V3) R2.1 R5.1 R6.1 R7.1 R8.1 U1.1(VCC1)
5V_BUS: C4.1 U1.8(VCC2)
CANH: L1.4(H_IC) U1.7(CANH)
CANH_EXT: D3.1(K1) L1.1(H_EXT)
CANL: L1.3(L_IC) U1.6(CANL)
CANL_EXT: D3.2(K2) L1.2(L_EXT)
ESP_BOOT: MCU1.8(GPIO9) R8.2 SW1.1(A)
ESP_EN: C10.1 MCU1.2(EN) R5.2 SW2.1(A)
ESP_GPIO2: MCU1.16(GPIO2) R6.2
ESP_GPIO8: MCU1.7(GPIO8) R7.2
GPIO6: MCU1.5(GPIO6) R3.1
GPIO7: MCU1.6(GPIO7) R4.2
RXD: R4.1 U1.3(RXD)
TXD: R2.2 R3.2 U1.2(TXD)
USB_CC1: J2.A5(CC1) R9.1
USB_CC2: J2.B5(CC2) R10.1
USB_DM: D6.6(IO1) R11.1
USB_DM_IN: D6.1(IO1) J2.A7(D-) J2.B7(D-)
USB_DM_MCU: MCU1.13(GPIO18/USB_D-) R11.2
USB_DP: D6.4(IO2) R12.1
USB_DP_IN: D6.3(IO2) J2.A6(D+) J2.B6(D+)
USB_DP_MCU: MCU1.14(GPIO19/USB_D+) R12.2
USB_VBUS: D6.5(VBUS) J2.A4_B9(VBUS) J2.B4_A9(VBUS)

Not connected (* = marked no-connect by the designer): J2 A8(SBU1)* B8(SBU2)*; MCU1 3(GPIO4)* 4(GPIO5)* 10(GPIO10)* 11(GPIO20/U0RXD)* 12(GPIO21/U0TXD)* 15(GPIO3)* 17(GPIO1)* 18(GPIO0)*

### Notes on the sheet
- ORION BRIDGE R4 / NMEA 2000 - BLE
- 23.09.2026 / Altium / JLCPCB
- 02  CAN / ESP32-C3 / USB und Service
- 04  Geschuetzter, isolierter CAN-Anschluss
- 05  ESP32-C3-WROOM-02-N4 / GPIO6 TX, GPIO7 RX
- 06  USB-C, ESD-Schutz und Abschlusswiderstaende
- BOOT halten und RESET kurz druecken: ROM-Downloadmodus.
- ESP-Antennenbereich ragt ueber den Platinenrand.
- EP19 ohne Paste; optionales EPAD bleibt ungeloetet.
- Alle gleichnamigen Netze sind projektweit verbunden.
- Bauteile und Pins referenzieren lokale SchLib/PcbLib.
- (in symbol R4_D6_USBLC6_2SC6) I/O1; I/O2

### Library data of the parts
C4 = R4_C4_100nF: 100nF 16V X7R - generic specification; manufacturer/MPN not selected; Manufacturer: YAGEO; MPN: CC0603KRX7R9BB104; ReviewStatus: R4 reviewed package; see source and assembly audit; Manufacturer Part Number: CC0603KRX7R9BB104; Datasheet: https://www.lcsc.com/datasheet/lcsc_datasheet_2211101700_YAGEO-CC0603KRX7R9BB104_C14663.pdf; Supplier 1: LCSC; Supplier Part Number 1: C14663; Footprint Status: R4 reviewed package; see source and assembly audit
C5 = R4_C5_100nF: 100nF 16V X7R - generic specification; manufacturer/MPN not selected; Manufacturer: YAGEO; MPN: CC0603KRX7R9BB104; ReviewStatus: R4 reviewed package; see source and assembly audit; Manufacturer Part Number: CC0603KRX7R9BB104; Datasheet: https://www.lcsc.com/datasheet/lcsc_datasheet_2211101700_YAGEO-CC0603KRX7R9BB104_C14663.pdf; Supplier 1: LCSC; Supplier Part Number 1: C14663; Footprint Status: R4 reviewed package; see source and assembly audit
C10 = R4_C10_1uF: Manufacturer: Samsung Electro-Mechanics; MPN: CL10A105KB8NNNC; ReviewStatus: R4 reviewed package; see source and assembly audit; Manufacturer Part Number: CL10A105KB8NNNC; Description: 1uF 50V X5R; Datasheet: https://www.lcsc.com/datasheet/lcsc_datasheet_2304140030_Samsung-Electro-Mechanics-CL10A105KB8NNNC_C15849.pdf; Supplier 1: LCSC; Supplier Part Number 1: C15849; Footprint Status: R4 reviewed package; see source and assembly audit
C11 = R4_C11_10uF: Manufacturer: Samsung Electro-Mechanics; MPN: CL21A106KAYNNNE; ReviewStatus: R4 reviewed package; see source and assembly audit; Manufacturer Part Number: CL21A106KAYNNNE; Description: 10uF 25V X5R; Datasheet: https://www.lcsc.com/datasheet/lcsc_datasheet_2304140030_Samsung-Electro-Mechanics-CL21A106KAYNNNE_C15850.pdf; Supplier 1: LCSC; Supplier Part Number 1: C15850; Footprint Status: R4 reviewed package; see source and assembly audit
C12 = R4_C12_100nF: Manufacturer: YAGEO; MPN: CC0603KRX7R9BB104; ReviewStatus: R4 reviewed package; see source and assembly audit; Manufacturer Part Number: CC0603KRX7R9BB104; Description: 100nF 50V X7R; Datasheet: https://www.lcsc.com/datasheet/lcsc_datasheet_2211101700_YAGEO-CC0603KRX7R9BB104_C14663.pdf; Supplier 1: LCSC; Supplier Part Number 1: C14663; Footprint Status: R4 reviewed package; see source and assembly audit
D3 = R4_D3_PESD2CAN24T_Q: Manufacturer: Nexperia; MPN: PESD2CAN24T-QR; ReviewStatus: R4 reviewed package; see source and assembly audit; Manufacturer Part Number: PESD2CAN24T-QR; Description: PESD2CAN24T-Q; Datasheet: https://assets.nexperia.com/documents/data-sheet/PESD2CAN24T-Q.pdf; Supplier 1: LCSC; Supplier Part Number 1: C28933048; Footprint Status: R4 reviewed package; see source and assembly audit
D6 = R4_D6_USBLC6_2SC6: Manufacturer: STMicroelectronics; ReviewStatus: R4 reviewed package; see source and assembly audit; MPN: USBLC6-2SC6; Manufacturer Part Number: USBLC6-2SC6; Description: USBLC6-2SC6; Datasheet: https://www.lcsc.com/datasheet/lcsc_datasheet_2410121836_STMicroelectronics-USBLC6-2SC6_C7519.pdf; Supplier 1: LCSC; Supplier Part Number 1: C7519; Footprint Status: R4 reviewed package; see source and assembly audit
J2 = R4_J2_TYPE_C_31_M_12: Manufacturer: Korean Hroparts Elec; ReviewStatus: R4 reviewed package; see source and assembly audit; MPN: TYPE-C-31-M-12; Manufacturer Part Number: TYPE-C-31-M-12; Description: TYPE-C-31-M-12; Datasheet: https://www.lcsc.com/datasheet/lcsc_datasheet_2205251630_Korean-Hroparts-Elec-TYPE-C-31-M-12_C165948.pdf; Supplier 1: LCSC; Supplier Part Number 1: C165948; Footprint Status: R4 reviewed package; see source and assembly audit
L1 = R4_L1_ACT45B_510_2P_TL003: Manufacturer: TDK; ReviewStatus: R4 reviewed package; see source and assembly audit; MPN: ACT45B-510-2P-TL003; Manufacturer Part Number: ACT45B-510-2P-TL003; Description: ACT45B-510-2P-TL003; Datasheet: https://www.lcsc.com/datasheet/lcsc_datasheet_1811151430_TDK-ACT45B-510-2P-TL003_C76584.pdf; Supplier 1: LCSC; Supplier Part Number 1: C76584; Footprint Status: R4 reviewed package; see source and assembly audit
MCU1 = R4_MCU1_ESP32_C3_WROOM_02_N4: Manufacturer: Espressif Systems; ReviewStatus: R4 reviewed package; see source and assembly audit; MPN: ESP32-C3-WROOM-02-N4; Manufacturer Part Number: ESP32-C3-WROOM-02-N4; Description: ESP32-C3-WROOM-02-N4; Datasheet: https://documentation.espressif.com/esp32-c3-wroom-02_datasheet_en.pdf; Supplier 1: LCSC; Supplier Part Number 1: C2934560; Footprint Status: R4 reviewed package; see source and assembly audit
R2 = R4_R2_10k: 10k - generic specification; manufacturer/MPN not selected; Manufacturer: UNI-ROYAL(Uniroyal Elec); MPN: 0603WAF1002T5E; ReviewStatus: R4 reviewed package; see source and assembly audit; Manufacturer Part Number: 0603WAF1002T5E; Datasheet: https://www.lcsc.com/datasheet/lcsc_datasheet_2206010045_UNI-ROYAL-Uniroyal-Elec-0603WAF1002T5E_C25804.pdf; Supplier 1: LCSC; Supplier Part Number 1: C25804; Footprint Status: R4 reviewed package; see source and assembly audit
R3 = R4_R3_33R: 33R - generic specification; manufacturer/MPN not selected; Manufacturer: UNI-ROYAL(Uniroyal Elec); MPN: 0603WAF330JT5E; Role: R_TX; ReviewStatus: R4 reviewed package; see source and assembly audit; Manufacturer Part Number: 0603WAF330JT5E; Datasheet: https://www.lcsc.com/datasheet/lcsc_datasheet_2206010116_UNI-ROYAL-Uniroyal-Elec-0603WAF330JT5E_C23140.pdf; Supplier 1: LCSC; Supplier Part Number 1: C23140; Footprint Status: R4 reviewed package; see source and assembly audit
R4 = R4_R4_33R: 33R - generic specification; manufacturer/MPN not selected; Manufacturer: UNI-ROYAL(Uniroyal Elec); MPN: 0603WAF330JT5E; Role: R_RX; ReviewStatus: R4 reviewed package; see source and assembly audit; Manufacturer Part Number: 0603WAF330JT5E; Datasheet: https://www.lcsc.com/datasheet/lcsc_datasheet_2206010116_UNI-ROYAL-Uniroyal-Elec-0603WAF330JT5E_C23140.pdf; Supplier 1: LCSC; Supplier Part Number 1: C23140; Footprint Status: R4 reviewed package; see source and assembly audit
R5 = R4_R5_10k: Manufacturer: UNI-ROYAL(Uniroyal Elec); MPN: 0603WAF1002T5E; ReviewStatus: R4 reviewed package; see source and assembly audit; Manufacturer Part Number: 0603WAF1002T5E; Description: 10k 1% 0.1W; Datasheet: https://www.lcsc.com/datasheet/lcsc_datasheet_2206010045_UNI-ROYAL-Uniroyal-Elec-0603WAF1002T5E_C25804.pdf; Supplier 1: LCSC; Supplier Part Number 1: C25804; Footprint Status: R4 reviewed package; see source and assembly audit
R6 = R4_R6_10k: Manufacturer: UNI-ROYAL(Uniroyal Elec); MPN: 0603WAF1002T5E; ReviewStatus: R4 reviewed package; see source and assembly audit; Manufacturer Part Number: 0603WAF1002T5E; Description: 10k 1% 0.1W; Datasheet: https://www.lcsc.com/datasheet/lcsc_datasheet_2206010045_UNI-ROYAL-Uniroyal-Elec-0603WAF1002T5E_C25804.pdf; Supplier 1: LCSC; Supplier Part Number 1: C25804; Footprint Status: R4 reviewed package; see source and assembly audit
R7 = R4_R7_10k: Manufacturer: UNI-ROYAL(Uniroyal Elec); MPN: 0603WAF1002T5E; ReviewStatus: R4 reviewed package; see source and assembly audit; Manufacturer Part Number: 0603WAF1002T5E; Description: 10k 1% 0.1W; Datasheet: https://www.lcsc.com/datasheet/lcsc_datasheet_2206010045_UNI-ROYAL-Uniroyal-Elec-0603WAF1002T5E_C25804.pdf; Supplier 1: LCSC; Supplier Part Number 1: C25804; Footprint Status: R4 reviewed package; see source and assembly audit
R8 = R4_R8_10k: Manufacturer: UNI-ROYAL(Uniroyal Elec); MPN: 0603WAF1002T5E; ReviewStatus: R4 reviewed package; see source and assembly audit; Manufacturer Part Number: 0603WAF1002T5E; Description: 10k 1% 0.1W; Datasheet: https://www.lcsc.com/datasheet/lcsc_datasheet_2206010045_UNI-ROYAL-Uniroyal-Elec-0603WAF1002T5E_C25804.pdf; Supplier 1: LCSC; Supplier Part Number 1: C25804; Footprint Status: R4 reviewed package; see source and assembly audit
R9 = R4_R9_5.1k: Manufacturer: UNI-ROYAL(Uniroyal Elec); MPN: 0603WAF5101T5E; ReviewStatus: R4 reviewed package; see source and assembly audit; Manufacturer Part Number: 0603WAF5101T5E; Description: 5.1k 1% 0.1W; Datasheet: https://www.lcsc.com/datasheet/lcsc_datasheet_2206010116_UNI-ROYAL-Uniroyal-Elec-0603WAF5101T5E_C23186.pdf; Supplier 1: LCSC; Supplier Part Number 1: C23186; Footprint Status: R4 reviewed package; see source and assembly audit
R10 = R4_R10_5.1k: Manufacturer: UNI-ROYAL(Uniroyal Elec); MPN: 0603WAF5101T5E; ReviewStatus: R4 reviewed package; see source and assembly audit; Manufacturer Part Number: 0603WAF5101T5E; Description: 5.1k 1% 0.1W; Datasheet: https://www.lcsc.com/datasheet/lcsc_datasheet_2206010116_UNI-ROYAL-Uniroyal-Elec-0603WAF5101T5E_C23186.pdf; Supplier 1: LCSC; Supplier Part Number 1: C23186; Footprint Status: R4 reviewed package; see source and assembly audit
R11 = R4_R11_22R: Manufacturer: UNI-ROYAL(Uniroyal Elec); MPN: 0603WAF220JT5E; ReviewStatus: R4 reviewed package; see source and assembly audit; Manufacturer Part Number: 0603WAF220JT5E; Description: 22R 1% 0.1W; Datasheet: https://www.lcsc.com/datasheet/lcsc_datasheet_2206010100_UNI-ROYAL-Uniroyal-Elec-0603WAF220JT5E_C23345.pdf; Supplier 1: LCSC; Supplier Part Number 1: C23345; Footprint Status: R4 reviewed package; see source and assembly audit
R12 = R4_R12_22R: Manufacturer: UNI-ROYAL(Uniroyal Elec); MPN: 0603WAF220JT5E; ReviewStatus: R4 reviewed package; see source and assembly audit; Manufacturer Part Number: 0603WAF220JT5E; Description: 22R 1% 0.1W; Datasheet: https://www.lcsc.com/datasheet/lcsc_datasheet_2206010100_UNI-ROYAL-Uniroyal-Elec-0603WAF220JT5E_C23345.pdf; Supplier 1: LCSC; Supplier Part Number 1: C23345; Footprint Status: R4 reviewed package; see source and assembly audit
SW1 = R4_SW1_TS_1088_AR02016: Manufacturer: XUNPU; ReviewStatus: R4 reviewed package; see source and assembly audit; MPN: TS-1088-AR02016; Manufacturer Part Number: TS-1088-AR02016; Description: TS-1088-AR02016; Datasheet: https://www.lcsc.com/datasheet/lcsc_datasheet_2304140030_XUNPU-TS-1088-AR02016_C720477.pdf; Supplier 1: LCSC; Supplier Part Number 1: C720477; Footprint Status: R4 reviewed package; see source and assembly audit
SW2 = R4_SW2_TS_1088_AR02016: Manufacturer: XUNPU; ReviewStatus: R4 reviewed package; see source and assembly audit; MPN: TS-1088-AR02016; Manufacturer Part Number: TS-1088-AR02016; Description: TS-1088-AR02016; Datasheet: https://www.lcsc.com/datasheet/lcsc_datasheet_2304140030_XUNPU-TS-1088-AR02016_C720477.pdf; Supplier 1: LCSC; Supplier Part Number 1: C720477; Footprint Status: R4 reviewed package; see source and assembly audit
U1 = R4_U1_ISO1042DWV: Manufacturer: Texas Instruments; MPN: ISO1042DWVR; ReviewStatus: R4 reviewed package; see source and assembly audit; Manufacturer Part Number: ISO1042DWVR; Description: ISO1042DWV; Datasheet: https://datasheet.lcsc.com/lcsc/2302212001_Texas-Instruments-ISO1042DWVR_C2671714.pdf; Supplier 1: LCSC; Supplier Part Number 1: C2671714; Footprint Status: R4 reviewed package; see source and assembly audit

## Nets that join several sheets
GND_BUS: Orion-Bridge-R4-Power (10 pins), Orion-Bridge-R4-Logic (C4.2 D3.3 U1.5)
GND_LOGIC: Orion-Bridge-R4-Power (10 pins), Orion-Bridge-R4-Logic (18 pins)
3V3_LOGIC: Orion-Bridge-R4-Power (C32.1 C33.1 L3.2 U4.1), Orion-Bridge-R4-Logic (10 pins)
5V_BUS: Orion-Bridge-R4-Power (7 pins), Orion-Bridge-R4-Logic (C4.1 U1.8)
CANH_EXT: Orion-Bridge-R4-Power (J1.4), Orion-Bridge-R4-Logic (D3.1 L1.1)
CANL_EXT: Orion-Bridge-R4-Power (J1.5), Orion-Bridge-R4-Logic (D3.2 L1.2)
USB_VBUS: Orion-Bridge-R4-Power (D4.2), Orion-Bridge-R4-Logic (D6.5 J2.A4_B9 J2.B4_A9)